# Altium project 4.3 - Auxiliary_Power_Board.PrjPcb
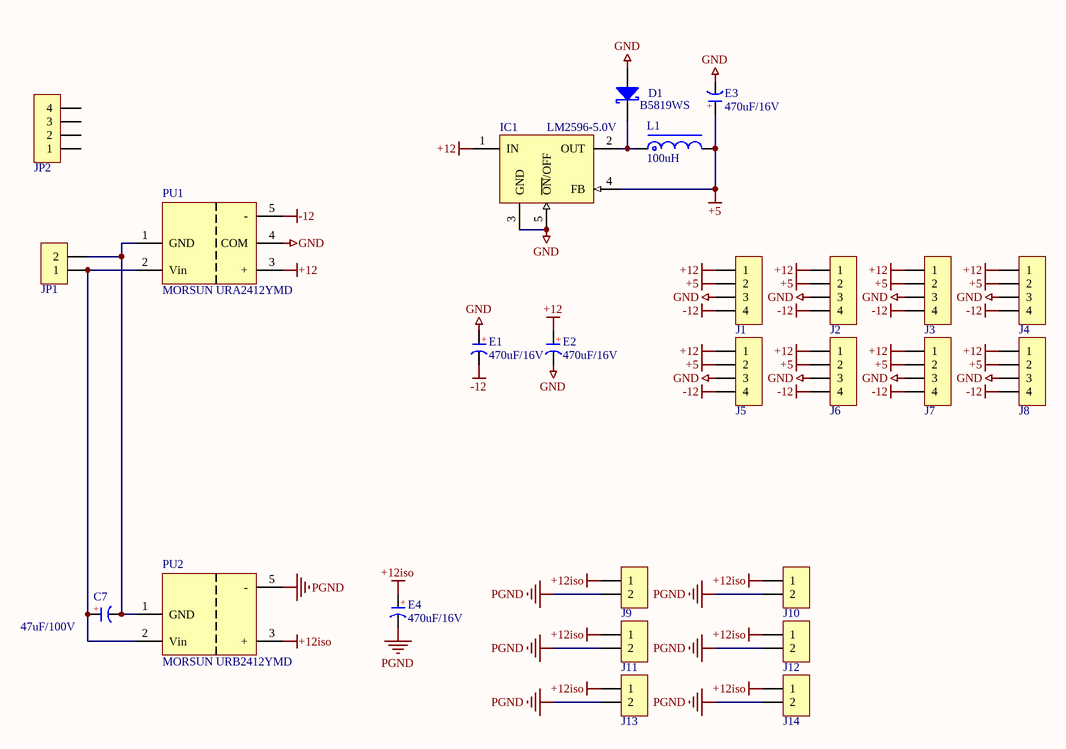
[diagram p0: Auxiliary_Power_Board.SchDoc]
1 sheet, 26 parts. Net scope: global (net labels, ports and power ports of the same name join across sheets).
Board file: Auxiliary_Power_Board.pcbdoc

## Sheet Auxiliary_Power_Board.SchDoc
size A4; DrawnBy: Copyright © 2023 by; Engineer: Artyom Kislevitz Lee; Revision: A; SheetNumber: 1; SheetTotal: 1

### Parts
C7  47uF/100V  [CAP 3.5*8*11.5 - BK]
D1  B5819WS  [DO-41]
E1  470uF/16V  [CS 2.5*6.3*11 - V]
E2  470uF/16V  [CS 2.5*6.3*11 - V]
E3  470uF/16V  [CS 2.5*6.3*11 - V]
E4  470uF/16V  [CS 2.5*6.3*11 - V]
IC1  LM2596-5.0V  [TO220-5C]
J1  HDR-1X4  [KF2510-LI-4P]  (value not drawn)
J2  HDR-1X4  [KF2510-LI-4P]  (value not drawn)
J3  HDR-1X4  [KF2510-LI-4P]  (value not drawn)
J4  HDR-1X4  [KF2510-LI-4P]  (value not drawn)
J5  HDR-1X4  [KF2510-LI-4P]  (value not drawn)
J6  HDR-1X4  [KF2510-LI-4P]  (value not drawn)
J7  HDR-1X4  [KF2510-LI-4P]  (value not drawn)
J8  HDR-1X4  [KF2510-LI-4P]  (value not drawn)
J9  HDR-1X2  [KF2510-LI-2P]  (value not drawn)
J10  HDR-1X2  [KF2510-LI-2P]  (value not drawn)
J11  HDR-1X2  [KF2510-LI-2P]  (value not drawn)
J12  HDR-1X2  [KF2510-LI-2P]  (value not drawn)
J13  HDR-1X2  [KF2510-LI-2P]  (value not drawn)
J14  HDR-1X2  [KF2510-LI-2P]  (value not drawn)
JP1  HDR-1X2  [KF7620-2P]  (value not drawn)
JP2  HDR-1X4  [KF7620-4P]  (value not drawn)
L1  100uH  [LMR135]
PU1  MORSUN URA2412YMD  [1in 2out]
PU2  MORSUN URB2412YMD  [1in 1out]

### Nets
+5: E3.1(A) IC1.4(FB) J1.2 J2.2 J3.2 J4.2 J5.2 J6.2 J7.2 J8.2 L1.2
+12: E2.1(A) IC1.1(IN) J1.1 J2.1 J3.1 J4.1 J5.1 J6.1 J7.1 J8.1 PU1.3(+)
+12iso: E4.1(A) J9.1 J10.1 J11.1 J12.1 J13.1 J14.1 PU2.3(+)
-12: E1.2(K) J1.4 J2.4 J3.4 J4.4 J5.4 J6.4 J7.4 J8.4 PU1.5(-)
GND: D1.1(A) E1.1(A) E2.2(K) E3.2(K) IC1.3(GND) IC1.5(~{ON}/OFF) J1.3 J2.3 J3.3 J4.3 J5.3 J6.3 J7.3 J8.3 PU1.4(COM)
PGND: E4.2(K) J9.2 J10.2 J11.2 J12.2 J13.2 J14.2 PU2.5(-)
NetC7_1: C7.1(A) JP1.1 PU1.2(Vin) PU2.2(Vin)
NetC7_2: C7.2(K) JP1.2 PU1.1(GND) PU2.1(GND)
NetD1_2: D1.2(K) IC1.2(OUT) L1.1

Not connected (* = marked no-connect by the designer): JP2 1 2 3 4

### Notes on the sheet
- Project
- Title
- Size:
- Date:
- A4
- Number:
- Time:
- Revision:
- Sheet
- of
- Copyright © 2023 by
- Artyom Kislevitz Lee
- File:
- (in symbol CE) +
- (in symbol CS) +

### Library data of the parts
C7 = CE: 直插电解电容; 淘宝ID: 小糖豆的小窝窝; BOM名称: 直插电解电容; 下单链接: https://item.taobao.com/item.htm?ft=t&id=613637044352
D1 = 1N5819: 肖特基二极管; 淘宝ID: 小糖豆的小窝窝; BOM名称: 肖特基二极管; 下单链接: https://item.taobao.com/item.htm?ft=t&id=613637044352
E1-E4 = CS: 直插固态电容; 淘宝ID: 小糖豆的小窝窝; BOM名称: 直插固态电容; 下单链接: https://item.taobao.com/item.htm?ft=t&id=613637044352
IC1 = LM2596-5.0: DC降压芯片; 淘宝ID: 小糖豆的小窝窝; BOM名称: DC降压芯片; 下单链接: https://item.taobao.com/item.htm?ft=t&id=613637044352
J1-J8 JP2 = Header 4: 4P接插件; 淘宝ID: 小糖豆的小窝窝; BOM名称: 4P接插件; 下单链接: https://item.taobao.com/item.htm?ft=t&id=613637044352
J9-J14 JP1 = Header 2: 2P接插件; 淘宝ID: 小糖豆的小窝窝; BOM名称: 2P接插件; 下单链接: https://item.taobao.com/item.htm?ft=t&id=613637044352
L1 = L-MR: 功率磁环电感; 淘宝ID: 小糖豆的小窝窝; BOM名称: 功率磁环电感; 下单链接: https://item.taobao.com/item.htm?ft=t&id=613637044352
PU1 = MORSUN 1in 2out
PU2 = MORSUN 1in 1out